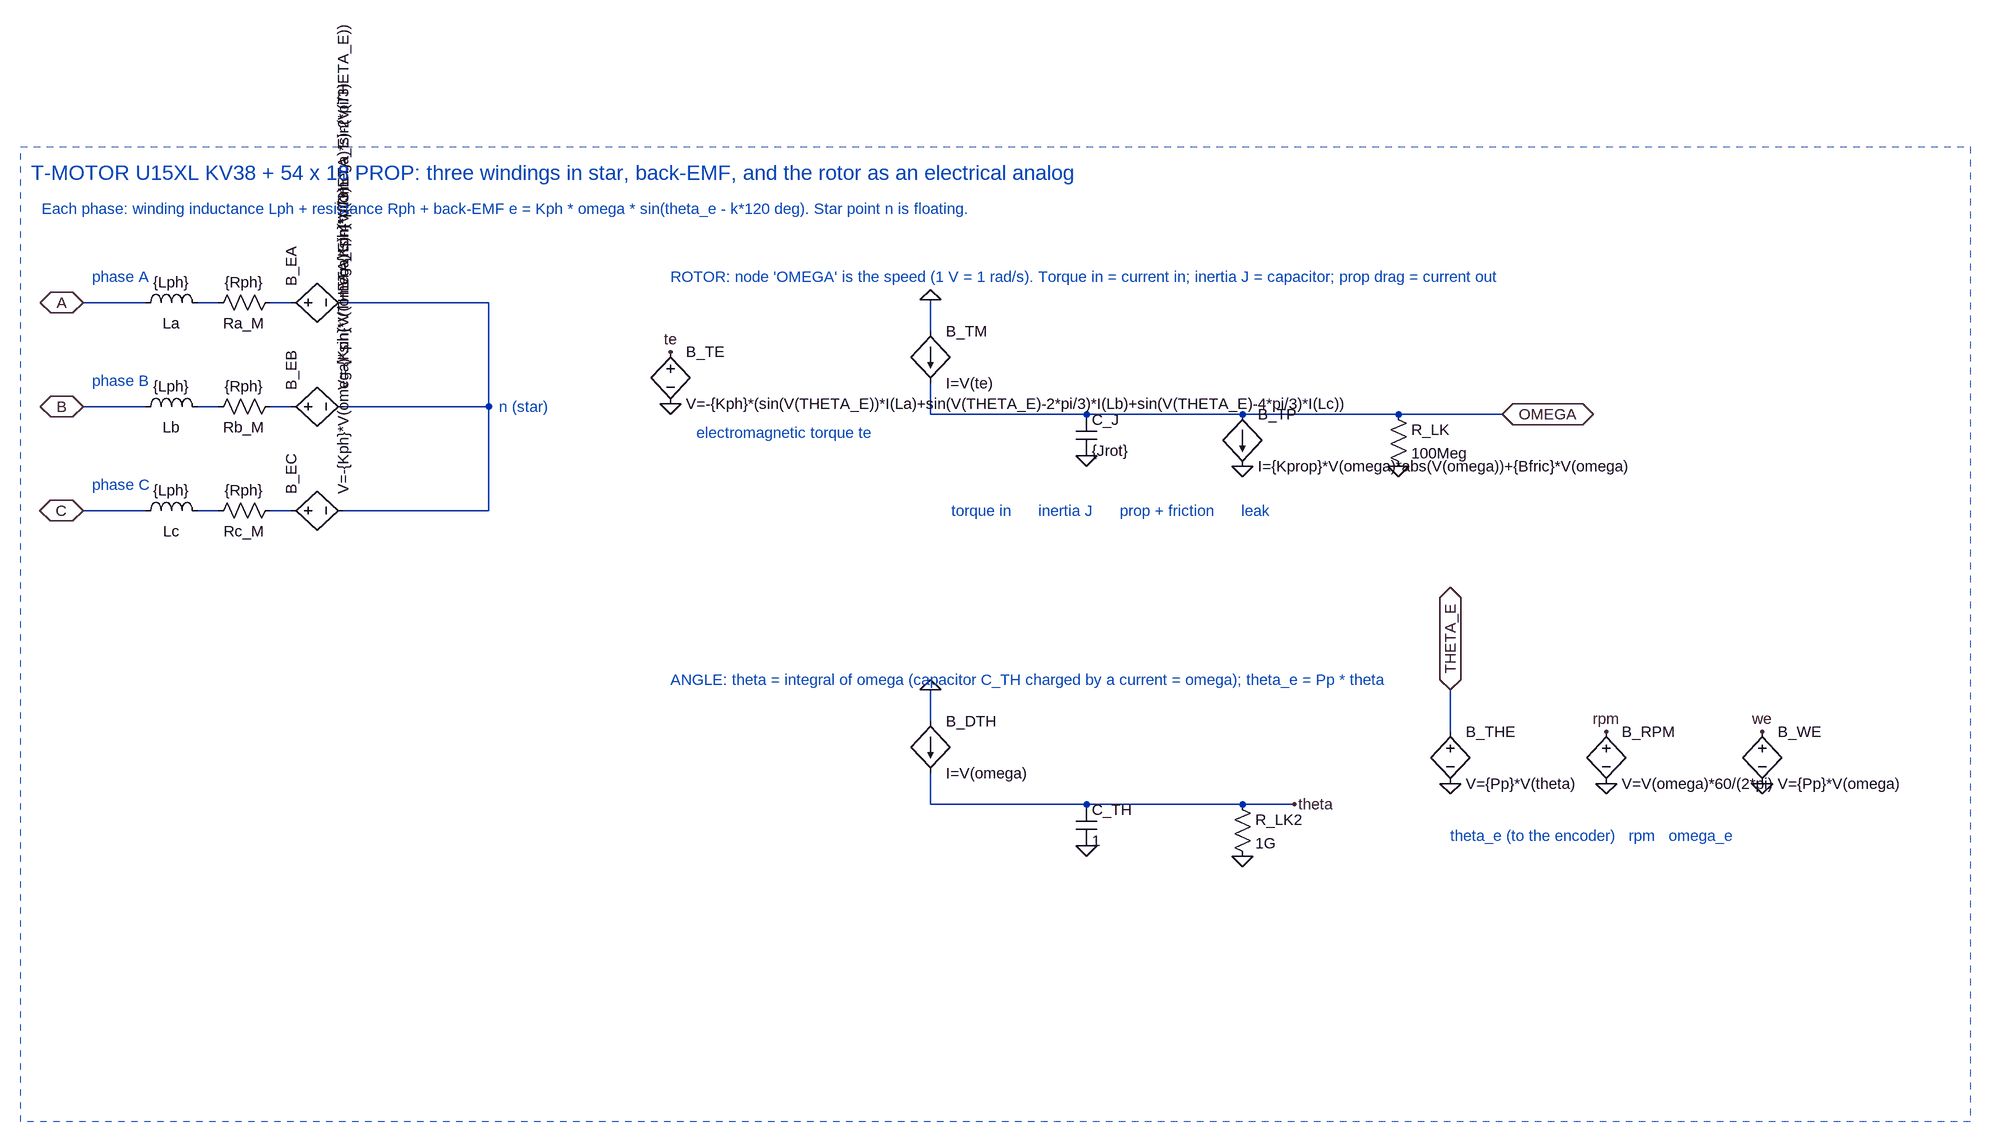
[diagram p0: schematic U15XL_Motor.asc]
U15XL_Motor.asc, the LTspice schematic file:
Version 4
SHEET 1 3480 1812
WIRE 96 240 192 240
WIRE 96 400 192 400
WIRE 96 560 192 560
WIRE 272 240 304 240
WIRE 272 400 304 400
WIRE 272 560 304 560
WIRE 384 240 416 240
WIRE 384 400 416 400
WIRE 384 560 416 560
WIRE 496 240 720 240
WIRE 496 400 720 400
WIRE 496 560 720 560
WIRE 720 240 720 400
WIRE 720 400 720 560
WIRE 1400 236 1400 284
WIRE 1400 364 1400 412
WIRE 1400 412 1640 412
WIRE 1400 836 1400 884
WIRE 1400 964 1400 1012
WIRE 1400 1012 1640 1012
WIRE 1640 412 1880 412
WIRE 1640 1012 1880 1012
WIRE 1880 412 2120 412
WIRE 1880 1012 1960 1012
WIRE 2120 412 2280 412
WIRE 2200 836 2200 900
FLAG 96 240 A
FLAG 96 400 B
FLAG 96 560 C
FLAG 1000 316 te
FLAG 1000 396 0
FLAG 1400 236 0
FLAG 1640 476 0
FLAG 1880 492 0
FLAG 2120 492 0
FLAG 2280 412 OMEGA
FLAG 1400 836 0
FLAG 1640 1076 0
FLAG 1880 1092 0
FLAG 1960 1012 theta
FLAG 2200 980 0
FLAG 2200 836 THETA_E
FLAG 2440 980 0
FLAG 2440 900 rpm
FLAG 2680 980 0
FLAG 2680 900 we
IOPIN 96 240 BiDir
IOPIN 96 400 BiDir
IOPIN 96 560 BiDir
IOPIN 2280 412 BiDir
IOPIN 2200 836 BiDir
SYMBOL ind 176 256 R270
WINDOW 0 0 56 VBottom 2
WINDOW 3 32 56 VTop 2
SYMATTR InstName La
SYMATTR Value {Lph}
SYMBOL res 288 256 R270
WINDOW 0 0 56 VBottom 2
WINDOW 3 32 56 VTop 2
SYMATTR InstName Ra_M
SYMATTR Value {Rph}
SYMBOL bv 400 240 R270
SYMATTR InstName B_EA
SYMATTR Value V=-{Kph}*V(omega)*sin(V(THETA_E))
SYMBOL ind 176 416 R270
WINDOW 0 0 56 VBottom 2
WINDOW 3 32 56 VTop 2
SYMATTR InstName Lb
SYMATTR Value {Lph}
SYMBOL res 288 416 R270
WINDOW 0 0 56 VBottom 2
WINDOW 3 32 56 VTop 2
SYMATTR InstName Rb_M
SYMATTR Value {Rph}
SYMBOL bv 400 400 R270
SYMATTR InstName B_EB
SYMATTR Value V=-{Kph}*V(omega)*sin(V(THETA_E)-2*pi/3)
SYMBOL ind 176 576 R270
WINDOW 0 0 56 VBottom 2
WINDOW 3 32 56 VTop 2
SYMATTR InstName Lc
SYMATTR Value {Lph}
SYMBOL res 288 576 R270
WINDOW 0 0 56 VBottom 2
WINDOW 3 32 56 VTop 2
SYMATTR InstName Rc_M
SYMATTR Value {Rph}
SYMBOL bv 400 560 R270
SYMATTR InstName B_EC
SYMATTR Value V=-{Kph}*V(omega)*sin(V(THETA_E)-4*pi/3)
SYMBOL bv 1000 300 R0
SYMATTR InstName B_TE
SYMATTR Value V=-{Kph}*(sin(V(THETA_E))*I(La)+sin(V(THETA_E)-2*pi/3)*I(Lb)+sin(V(THETA_E)-4*pi/3)*I(Lc))
SYMBOL bi 1400 284 R0
SYMATTR InstName B_TM
SYMATTR Value I=V(te)
SYMBOL cap 1624 412 R0
SYMATTR InstName C_J
SYMATTR Value {Jrot}
SYMBOL bi 1880 412 R0
SYMATTR InstName B_TP
SYMATTR Value I={Kprop}*V(omega)*abs(V(omega))+{Bfric}*V(omega)
SYMBOL res 2104 396 R0
SYMATTR InstName R_LK
SYMATTR Value 100Meg
SYMBOL bi 1400 884 R0
SYMATTR InstName B_DTH
SYMATTR Value I=V(omega)
SYMBOL cap 1624 1012 R0
SYMATTR InstName C_TH
SYMATTR Value 1
SYMBOL res 1864 996 R0
SYMATTR InstName R_LK2
SYMATTR Value 1G
SYMBOL bv 2200 884 R0
SYMATTR InstName B_THE
SYMATTR Value V={Pp}*V(theta)
SYMBOL bv 2440 884 R0
SYMATTR InstName B_RPM
SYMATTR Value V=V(omega)*60/(2*pi)
SYMBOL bv 2680 884 R0
SYMATTR InstName B_WE
SYMATTR Value V={Pp}*V(omega)
RECTANGLE Normal 3000 1500 0 0 2
TEXT 16 40 Left 3 ;T-MOTOR U15XL KV38 + 54 x 18 PROP: three windings in star, back-EMF, and the rotor as an electrical analog
TEXT 32 96 Left 2 ;Each phase: winding inductance Lph + resistance Rph + back-EMF e = Kph * omega * sin(theta_e - k*120 deg). Star point n is floating.
TEXT 110 200 Left 2 ;phase A
TEXT 110 360 Left 2 ;phase B
TEXT 110 520 Left 2 ;phase C
TEXT 736 400 Left 2 ;n (star)
TEXT 1000 200 Left 2 ;ROTOR: node 'OMEGA' is the speed (1 V = 1 rad/s). Torque in = current in; inertia J = capacitor; prop drag = current out
TEXT 1040 440 Left 2 ;electromagnetic torque te
TEXT 1432 560 Left 2 ;torque in      inertia J      prop + friction      leak
TEXT 1000 820 Left 2 ;ANGLE: theta = integral of omega (capacitor C_TH charged by a current = omega); theta_e = Pp * theta
TEXT 2200 1060 Left 2 ;theta_e (to the encoder)   rpm   omega_e

The netlist it stands for:
* U15XL_Motor.asc
La A N001 {Lph}
Ra_M N001 N004 {Rph}
B_EA N004 N007 V=-{Kph}*V(omega)*sin(V(THETA_E))
Lb B N002 {Lph}
Rb_M N002 N005 {Rph}
B_EB N005 N007 V=-{Kph}*V(omega)*sin(V(THETA_E)-2*pi/3)
Lc C N003 {Lph}
Rc_M N003 N006 {Rph}
B_EC N006 N007 V=-{Kph}*V(omega)*sin(V(THETA_E)-4*pi/3)
B_TE te 0 V=-{Kph}*(sin(V(THETA_E))*I(La)+sin(V(THETA_E)-2*pi/3)*I(Lb)+sin(V(THETA_E)-4*pi/3)*I(Lc))
B_TM 0 OMEGA I=V(te)
C_J OMEGA 0 {Jrot}
B_TP OMEGA 0 I={Kprop}*V(omega)*abs(V(omega))+{Bfric}*V(omega)
R_LK OMEGA 0 100Meg
B_DTH 0 theta I=V(omega)
C_TH theta 0 1
R_LK2 theta 0 1G
B_THE THETA_E 0 V={Pp}*V(theta)
B_RPM rpm 0 V=V(omega)*60/(2*pi)
B_WE we 0 V={Pp}*V(omega)
* T-MOTOR U15XL KV38 + 54 x 18 PROP: three windings in star, back-EMF, and the rotor as an electrical analog
* Each phase: winding inductance Lph + resistance Rph + back-EMF e = Kph * omega * sin(theta_e - k*120 deg). Star point n is floating.
* phase A
* phase B
* phase C
* n (star)
* ROTOR: node 'OMEGA' is the speed (1 V = 1 rad/s). Torque in = current in; inertia J = capacitor; prop drag = current out
* electromagnetic torque te
* torque in      inertia J      prop + friction      leak
* ANGLE: theta = integral of omega (capacitor C_TH charged by a current = omega); theta_e = Pp * theta
* theta_e (to the encoder)   rpm   omega_e
.backanno
.end